# Altium schematic sheet FC_RGB.SchDoc
size A2; SheetNumber: 1; SheetTotal: 1
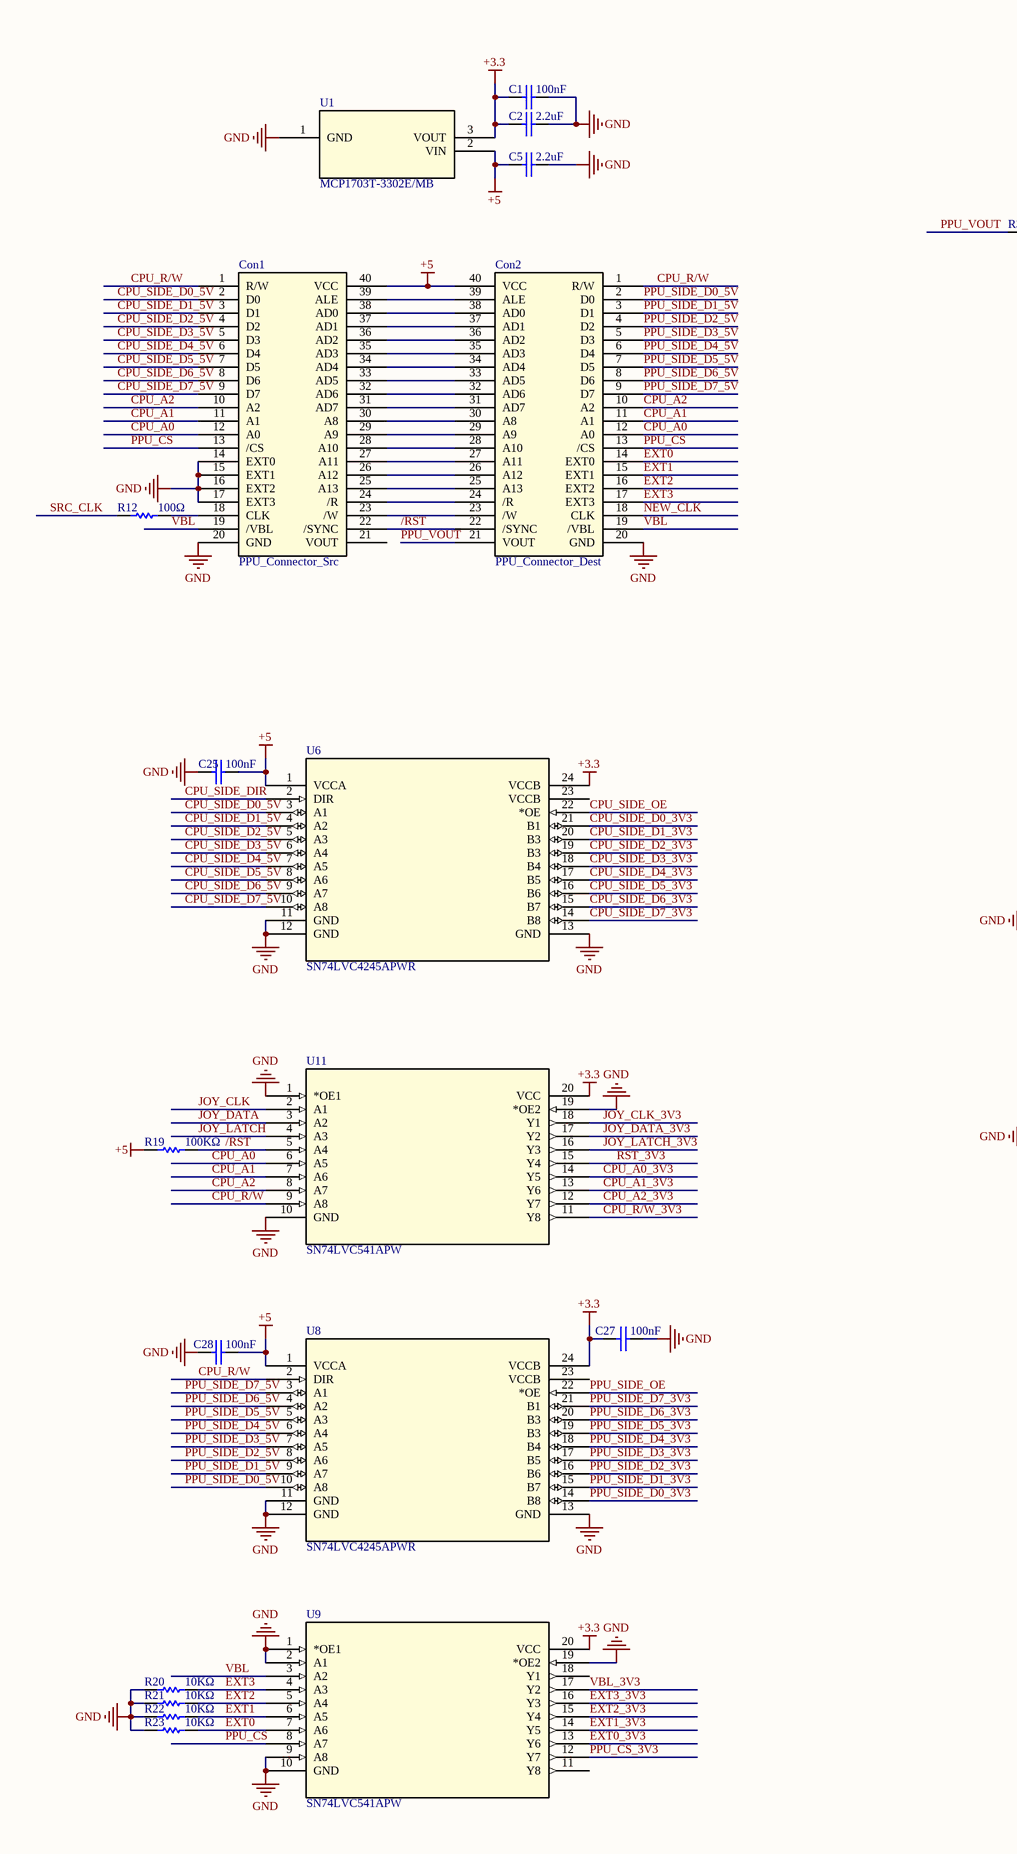
[diagram p0: FC_RGB.SchDoc, left]
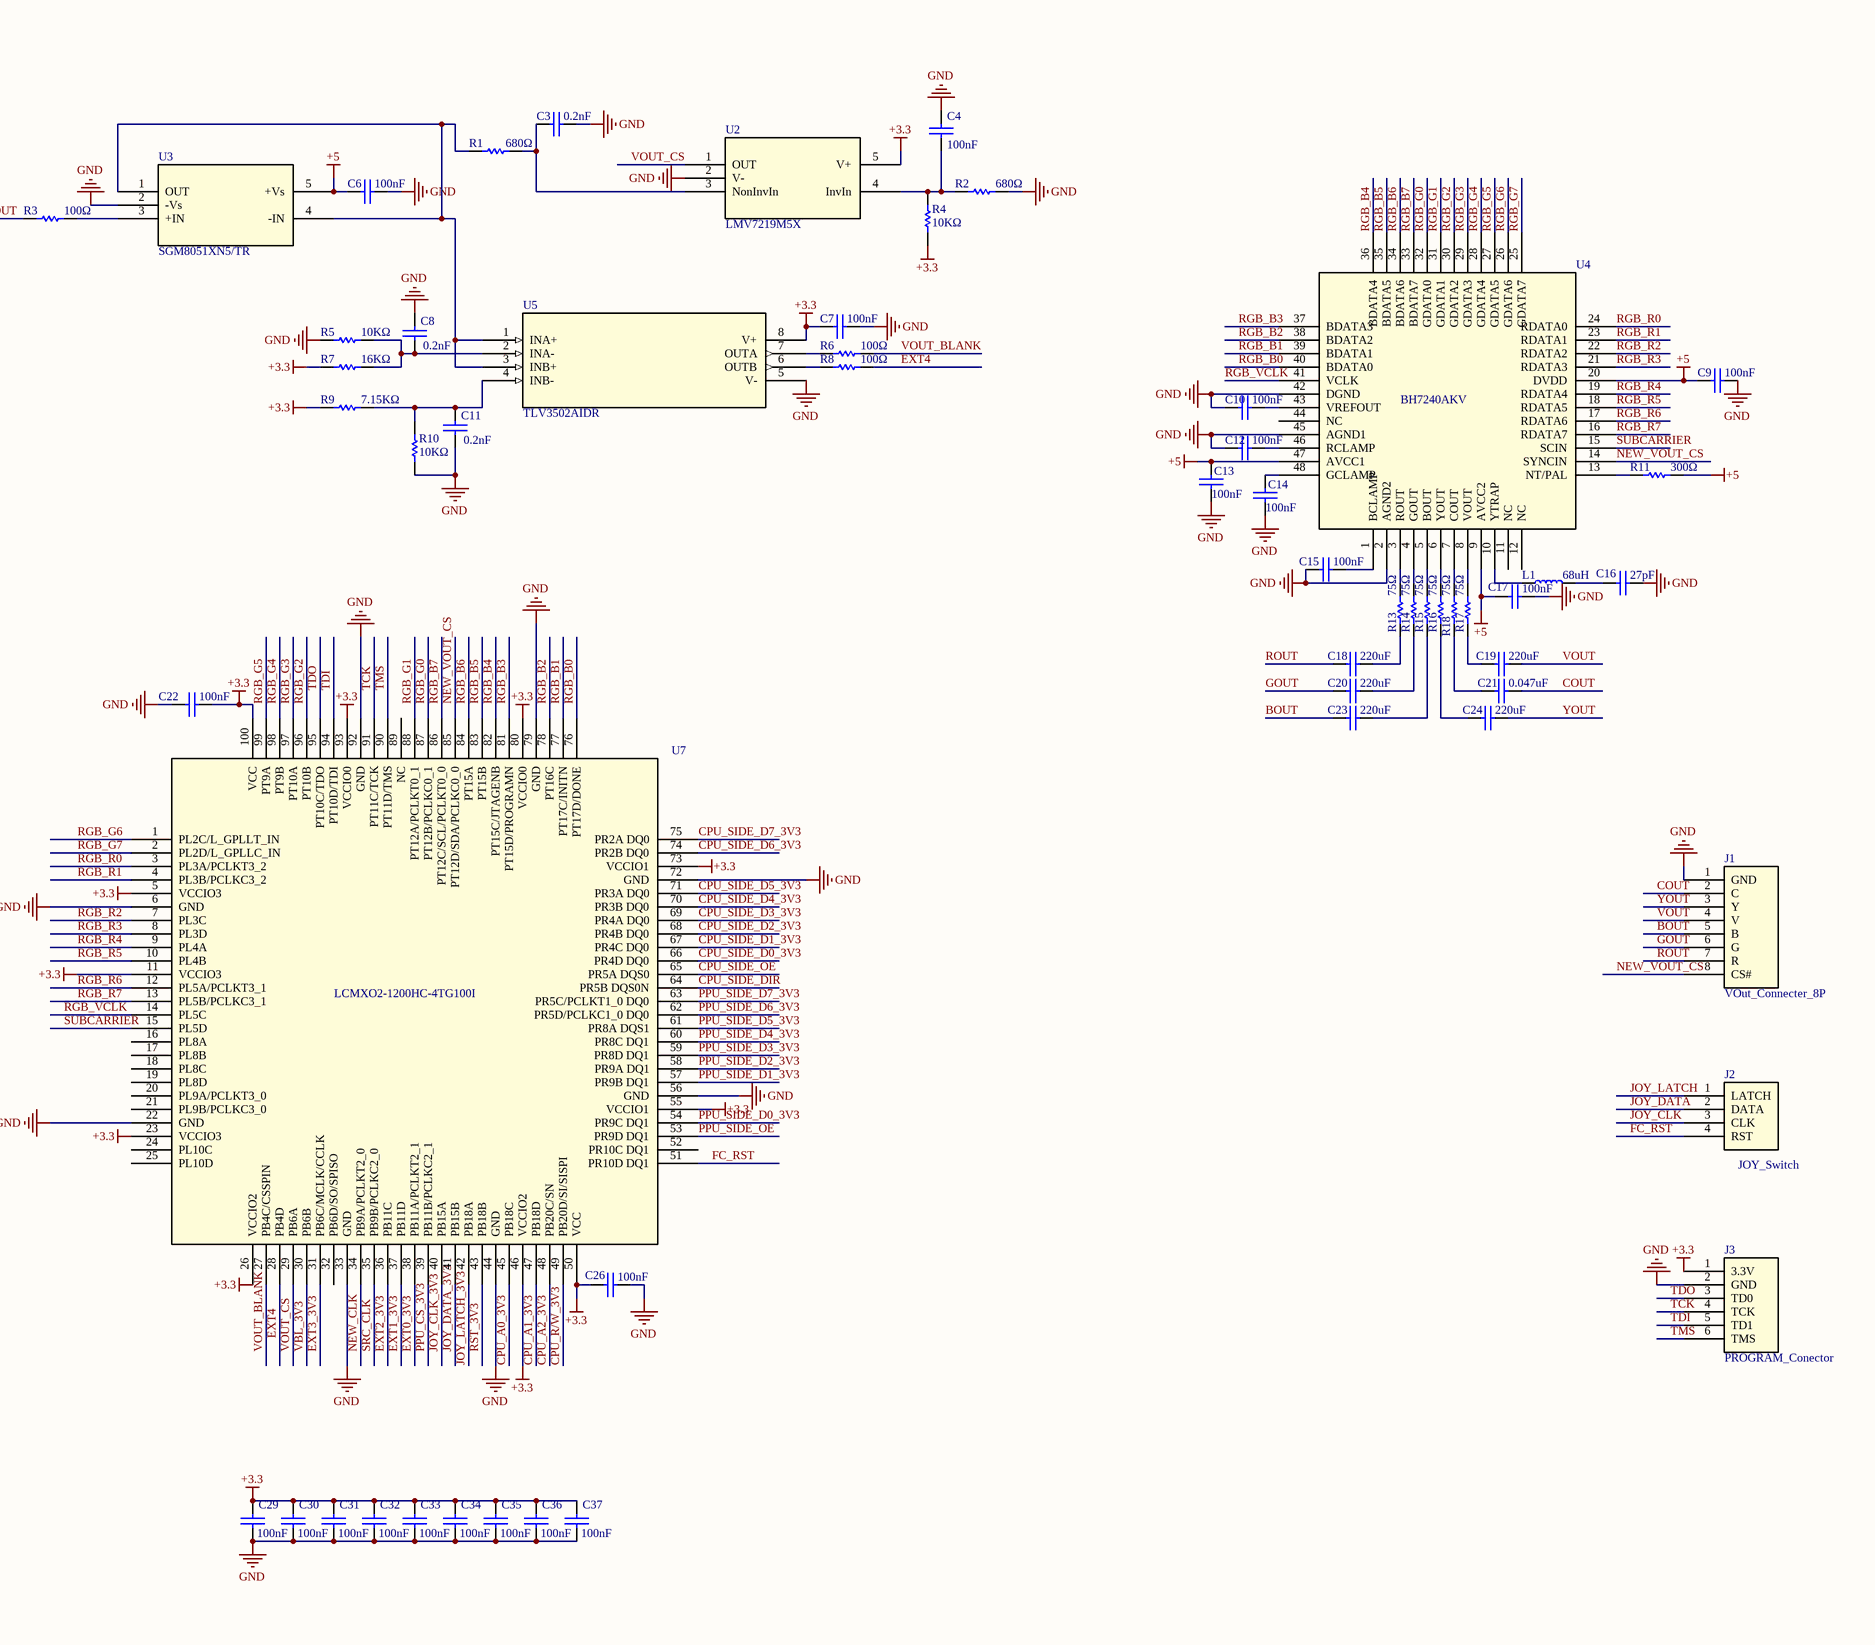
[diagram p1: FC_RGB.SchDoc, right]

## Parts
C1  100nF  [0603_C]
C2  2.2uF  [0805_C]
C3  0.2nF  [0603_C]
C4  100nF  [0603_C]
C5  2.2uF  [0805_C]
C6  100nF  [0603_C]
C7  100nF  [0603_C]
C8  0.2nF  [0603_C]
C9  100nF  [0603_C]
C10  100nF  [0603_C]
C11  0.2nF  [0603_C]
C12  100nF  [0603_C]
C13  100nF  [0603_C]
C14  100nF  [0603_C]
C15  100nF  [0603_C]
C16  27pF  [0603_C]
C17  100nF  [0603_C]
C18  220uF  [C 1206_L]
C19  220uF  [C 1206_L]
C20  220uF  [C 1206_L]
C21  0.047uF  [C 1206_L]
C22  100nF  [0603_C]
C23  220uF  [C 1206_L]
C24  220uF  [C 1206_L]
C25  100nF  [0603_C]
C26  100nF  [0603_C]
C27  100nF  [0603_C]
C28  100nF  [0603_C]
C29  100nF  [0603_C]
C30  100nF  [0603_C]
C31  100nF  [0603_C]
C32  100nF  [0603_C]
C33  100nF  [0603_C]
C34  100nF  [0603_C]
C35  100nF  [0603_C]
C36  100nF  [0603_C]
C37  100nF  [0603_C]
Con1  PPU_Connector_Src  [DIP40_SRC]
Con2  PPU_Connector_Dest  [DIP40_DEST]
J1  VOut_Connecter_8P  [CON_VIDEO_OUT_8P]
J2  JOY_Switch  [CON_JOY]
J3  PROGRAM_Conector  [CON_PROGRAM]
L1  68uH  [L 0805]
R1  680Ω  [0603_R]
R2  680Ω  [0603_R]
R3  100Ω  [0603_R]
R4  10KΩ  [0603_R]
R5  10KΩ  [0603_R]
R6  100Ω  [0603_R]
R7  16KΩ  [0603_R]
R8  100Ω  [0603_R]
R9  7.15KΩ  [0603_R]
R10  10KΩ  [0603_R]
R11  300Ω  [0603_R]
R12  100Ω  [0603_R]
R13  75Ω  [0603_R]
R14  75Ω  [0603_R]
R15  75Ω  [0603_R]
R16  75Ω  [0603_R]
R17  75Ω  [0603_R]
R18  75Ω  [0603_R]
R19  100KΩ  [0603_R]
R20  10KΩ  [0603_R]
R21  10KΩ  [0603_R]
R22  10KΩ  [0603_R]
R23  10KΩ  [0603_R]
U1  MCP1703T-3302E/MB  [SOT-89_3MC_MCH]
U2  LMV7219M5X  [MF05A]
U3  SGM8051XN5/TR  [MF05A]
U4  BH7240AKV  [LQFP48-7*7]
U5  TLV3502AIDR  [D8]
U6  SN74LVC4245APWR  [PW24]
U7  LCMXO2-1200HC-4TG100I  [TQFP100_LAT]
U8  SN74LVC4245APWR  [PW24]
U9  SN74LVC541APW  [PW20]
U11  SN74LVC541APW  [PW20]

## Nets
+3.3: C1.1 C2.1 C7.1 C22.2 C26.1 C27.1 C29.2 C30.2 C31.2 C32.2 C33.2 C34.2 C35.2 C36.2 C37.2 J3.1(3.3V) R4.1 R7.1 R9.1 U1.3(VOUT) U2.5(V+) U5.8(V+) U6.24(VCCB) U7.5(VCCIO3) U7.11(VCCIO3) U7.23(VCCIO3) U7.26(VCCIO2) U7.46(VCCIO2) U7.50(VCC) U7.55(VCCIO1) U7.73(VCCIO1) U7.80(VCCIO0) U7.93(VCCIO0) U7.100(VCC) U8.24(VCCB) U9.20(VCC) U11.20(VCC)
+5: C5.1 C6.1 C9.1 C13.2 C17.1 C25.2 C28.2 Con1.40(VCC) Con2.40(VCC) R11.2 R19.2 U1.2(VIN) U3.5(+Vs) U4.9(AVCC2) U4.20(DVDD) U4.47(AVCC1) U6.1(VCCA) U8.1(VCCA)
GND: C1.2 C2.2 C3.2 C4.2 C5.2 C6.2 C7.2 C8.2 C9.2 C10.1 C11.1 C12.1 C13.1 C14.1 C15.1 C16.2 C17.2 C22.1 C25.1 C26.2 C27.2 C28.1 C29.1 C30.1 C31.1 C32.1 C33.1 C34.1 C35.1 C36.1 C37.1 Con1.14(EXT0) Con1.15(EXT1) Con1.16(EXT2) Con1.17(EXT3) Con1.20(GND) Con2.20(GND) J1.1(GND) J3.2(GND) R2.2 R5.1 R10.1 R20.1 R21.1 R22.1 R23.1 U1.1(GND) U2.2(V-) U3.2(-Vs) U4.2(AGND2) U4.42(DGND) U4.45(AGND1) U5.5(V-) U6.11(GND) U6.12(GND) U6.13(GND) U7.6(GND) U7.22(GND) U7.33(GND) U7.44(GND) U7.56(GND) U7.72(GND) U7.79(GND) U7.92(GND) U8.11(GND) U8.12(GND) U8.13(GND) U9.1(*OE1) U9.2(A1) U9.9(A8) U9.10(GND) U9.19(*OE2) U11.1(*OE1) U11.10(GND) U11.19(*OE2)
/RST: Con1.22(/SYNC) Con2.22(/SYNC) R19.1 U11.5(A4)
BOUT: C23.2 J1.5(B)
COUT: C21.2 J1.2(C)
CPU_A0: Con1.12(A0) Con2.12(A0) U11.6(A5)
CPU_A0_3V3: U7.45(PB18C) U11.14(Y5)
CPU_A1: Con1.11(A1) Con2.11(A1) U11.7(A6)
CPU_A1_3V3: U7.47(PB18D) U11.13(Y6)
CPU_A2: Con1.10(A2) Con2.10(A2) U11.8(A7)
CPU_A2_3V3: U7.48(PB20C/SN) U11.12(Y7)
CPU_R/W: Con1.1(R/W) Con2.1(R/W) U8.2(DIR) U11.9(A8)
CPU_R/W_3V3: U7.49(PB20D/SI/SISPI) U11.11(Y8)
CPU_SIDE_D0_3V3: U6.21(B1) U7.66(PR4D_DQ0)
CPU_SIDE_D0_5V: Con1.2(D0) U6.3(A1)
CPU_SIDE_D1_3V3: U6.20(B3) U7.67(PR4C_DQ0)
CPU_SIDE_D1_5V: Con1.3(D1) U6.4(A2)
CPU_SIDE_D2_3V3: U6.19(B3) U7.68(PR4B_DQ0)
CPU_SIDE_D2_5V: Con1.4(D2) U6.5(A3)
CPU_SIDE_D3_3V3: U6.18(B4) U7.69(PR4A_DQ0)
CPU_SIDE_D3_5V: Con1.5(D3) U6.6(A4)
CPU_SIDE_D4_3V3: U6.17(B5) U7.70(PR3B_DQ0)
CPU_SIDE_D4_5V: Con1.6(D4) U6.7(A5)
CPU_SIDE_D5_3V3: U6.16(B6) U7.71(PR3A_DQ0)
CPU_SIDE_D5_5V: Con1.7(D5) U6.8(A6)
CPU_SIDE_D6_3V3: U6.15(B7) U7.74(PR2B_DQ0)
CPU_SIDE_D6_5V: Con1.8(D6) U6.9(A7)
CPU_SIDE_D7_3V3: U6.14(B8) U7.75(PR2A_DQ0)
CPU_SIDE_D7_5V: Con1.9(D7) U6.10(A8)
CPU_SIDE_DIR: U6.2(DIR) U7.64(PR5B_DQS0N)
CPU_SIDE_OE: U6.22(*OE) U7.65(PR5A_DQS0)
EXT0: Con2.14(EXT0) R23.2 U9.7(A6)
EXT0_3V3: U7.38(PB11A/PCLKT2_1) U9.13(Y6)
EXT1: Con2.15(EXT1) R22.2 U9.6(A5)
EXT1_3V3: U7.37(PB11D) U9.14(Y5)
EXT2: Con2.16(EXT2) R21.2 U9.5(A4)
EXT2_3V3: U7.36(PB11C) U9.15(Y4)
EXT3: Con2.17(EXT3) R20.2 U9.4(A3)
EXT3_3V3: U7.31(PB6C/MCLK/CCLK) U9.16(Y3)
EXT4: R8.2 U7.28(PB4D)
FC_RST: J2.4(RST) U7.51(PR10D_DQ1)
GOUT: C20.2 J1.6(G)
JOY_CLK: J2.3(CLK) U11.2(A1)
JOY_CLK_3V3: U7.40(PB15A) U11.18(Y1)
JOY_DATA: J2.2(DATA) U11.3(A2)
JOY_DATA_3V3: U7.41(PB15B) U11.17(Y2)
JOY_LATCH: J2.1(LATCH) U11.4(A3)
JOY_LATCH_3V3: U7.42(PB18A) U11.16(Y3)
NEW_CLK: Con2.18(CLK) U7.34(PB9A/PCLKT2_0)
NEW_VOUT_CS: J1.8(CS#) U4.14(SYNCIN) U7.85(PT12D/SDA/PCLKC0_0)
PPU_CS: Con1.13(/CS) Con2.13(/CS) U9.8(A7)
PPU_CS_3V3: U7.39(PB11B/PCLKC2_1) U9.12(Y7)
PPU_SIDE_D0_3V3: U7.54(PR9C_DQ1) U8.14(B8)
PPU_SIDE_D0_5V: Con2.2(D0) U8.10(A8)
PPU_SIDE_D1_3V3: U7.57(PR9B_DQ1) U8.15(B7)
PPU_SIDE_D1_5V: Con2.3(D1) U8.9(A7)
PPU_SIDE_D2_3V3: U7.58(PR9A_DQ1) U8.16(B6)
PPU_SIDE_D2_5V: Con2.4(D2) U8.8(A6)
PPU_SIDE_D3_3V3: U7.59(PR8D_DQ1) U8.17(B5)
PPU_SIDE_D3_5V: Con2.5(D3) U8.7(A5)
PPU_SIDE_D4_3V3: U7.60(PR8C_DQ1) U8.18(B4)
PPU_SIDE_D4_5V: Con2.6(D4) U8.6(A4)
PPU_SIDE_D5_3V3: U7.61(PR8A_DQS1) U8.19(B3)
PPU_SIDE_D5_5V: Con2.7(D5) U8.5(A3)
PPU_SIDE_D6_3V3: U7.62(PR5D/PCLKC1_0_DQ0) U8.20(B3)
PPU_SIDE_D6_5V: Con2.8(D6) U8.4(A2)
PPU_SIDE_D7_3V3: U7.63(PR5C/PCLKT1_0_DQ0) U8.21(B1)
PPU_SIDE_D7_5V: Con2.9(D7) U8.3(A1)
PPU_SIDE_OE: U7.53(PR9D_DQ1) U8.22(*OE)
PPU_VOUT: Con2.21(VOUT) R3.1
RGB_B0: U4.40(BDATA0) U7.76(PT17D/DONE)
RGB_B1: U4.39(BDATA1) U7.77(PT17C/INITN)
RGB_B2: U4.38(BDATA2) U7.78(PT16C)
RGB_B3: U4.37(BDATA3) U7.81(PT15D/PROGRAMN)
RGB_B4: U4.36(BDATA4) U7.82(PT15C/JTAGENB)
RGB_B5: U4.35(BDATA5) U7.83(PT15B)
RGB_B6: U4.34(BDATA6) U7.84(PT15A)
RGB_B7: U4.33(BDATA7) U7.86(PT12C/SCL/PCLKT0_0)
RGB_G0: U4.32(GDATA0) U7.87(PT12B/PCLKC0_1)
RGB_G1: U4.31(GDATA1) U7.88(PT12A/PCLKT0_1)
RGB_G2: U4.30(GDATA2) U7.96(PT10B)
RGB_G3: U4.29(GDATA3) U7.97(PT10A)
RGB_G4: U4.28(GDATA4) U7.98(PT9B)
RGB_G5: U4.27(GDATA5) U7.99(PT9A)
RGB_G6: U4.26(GDATA6) U7.1(PL2C/L_GPLLT_IN)
RGB_G7: U4.25(GDATA7) U7.2(PL2D/L_GPLLC_IN)
RGB_R0: U4.24(RDATA0) U7.3(PL3A/PCLKT3_2)
RGB_R1: U4.23(RDATA1) U7.4(PL3B/PCLKC3_2)
RGB_R2: U4.22(RDATA2) U7.7(PL3C)
RGB_R3: U4.21(RDATA3) U7.8(PL3D)
RGB_R4: U4.19(RDATA4) U7.9(PL4A)
RGB_R5: U4.18(RDATA5) U7.10(PL4B)
RGB_R6: U4.17(RDATA6) U7.12(PL5A/PCLKT3_1)
RGB_R7: U4.16(RDATA7) U7.13(PL5B/PCLKC3_1)
RGB_VCLK: U4.41(VCLK) U7.14(PL5C)
ROUT: C18.2 J1.7(R)
RST_3V3: U7.43(PB18B) U11.15(Y4)
SRC_CLK: R12.1 U7.35(PB9B/PCLKC2_0)
SUBCARRIER: U4.15(SCIN) U7.15(PL5D)
TCK: J3.4(TCK) U7.91(PT11C/TCK)
TDI: J3.5(TD1) U7.94(PT10D/TDI)
TDO: J3.3(TD0) U7.95(PT10C/TDO)
TMS: J3.6(TMS) U7.90(PT11D/TMS)
VBL: Con1.19(/VBL) Con2.19(/VBL) U9.3(A2)
VBL_3V3: U7.30(PB6B) U9.17(Y2)
VOUT: C19.1 J1.4(V)
VOUT_BLANK: R6.2 U7.27(PB4C/CSSPIN)
VOUT_CS: U2.1(OUT) U7.29(PB6A)
YOUT: C24.1 J1.3(Y)
NetC3_1: C3.1 R1.2 U2.3(NonInvIn)
NetC4_1: C4.1 R2.1 R4.2 U2.4(InvIn)
NetC8_1: C8.1 R5.2 R7.2 U5.2(INA-)
NetC10_2: C10.2 U4.43(VREFOUT)
NetC11_2: C11.2 R9.2 R10.2 U5.4(INB-)
NetC12_2: C12.2 U4.46(RCLAMP)
NetC14_2: C14.2 U4.48(GCLAMP)
NetC15_2: C15.2 U4.1(BCLAMP)
NetC16_1: C16.1 L1.2
NetC18_1: C18.1 R13.1
NetC19_2: C19.2 R17.1
NetC20_1: C20.1 R14.1
NetC21_1: C21.1 R18.1
NetC23_1: C23.1 R15.1
NetC24_2: C24.2 R16.1
NetCon1_18: Con1.18(CLK) R12.2
NetCon1_23: Con1.23(/W) Con2.23(/W)
NetCon1_24: Con1.24(/R) Con2.24(/R)
NetCon1_25: Con1.25(A13) Con2.25(A13)
NetCon1_26: Con1.26(A12) Con2.26(A12)
NetCon1_27: Con1.27(A11) Con2.27(A11)
NetCon1_28: Con1.28(A10) Con2.28(A10)
NetCon1_29: Con1.29(A9) Con2.29(A9)
NetCon1_30: Con1.30(A8) Con2.30(A8)
NetCon1_31: Con1.31(AD7) Con2.31(AD7)
NetCon1_32: Con1.32(AD6) Con2.32(AD6)
NetCon1_33: Con1.33(AD5) Con2.33(AD5)
NetCon1_34: Con1.34(AD4) Con2.34(AD4)
NetCon1_35: Con1.35(AD3) Con2.35(AD3)
NetCon1_36: Con1.36(AD2) Con2.36(AD2)
NetCon1_37: Con1.37(AD1) Con2.37(AD1)
NetCon1_38: Con1.38(AD0) Con2.38(AD0)
NetCon1_39: Con1.39(ALE) Con2.39(ALE)
NetL1_1: L1.1 U4.10(YTRAP)
NetR1_1: R1.1 U3.1(OUT) U3.4(-IN) U5.1(INA+) U5.3(INB+)
NetR3_2: R3.2 U3.3(+IN)
NetR6_1: R6.1 U5.7(OUTA)
NetR8_1: R8.1 U5.6(OUTB)
NetR11_1: R11.1 U4.13(NT/PAL)
NetR13_2: R13.2 U4.3(ROUT)
NetR14_2: R14.2 U4.4(GOUT)
NetR15_2: R15.2 U4.5(BOUT)
NetR16_2: R16.2 U4.6(YOUT)
NetR17_2: R17.2 U4.8(VOUT)
NetR18_2: R18.2 U4.7(COUT)

Not connected (* = marked no-connect by the designer): Con1 21(VOUT); U4 11(NC) 12(NC) 44(NC); U6 23(VCCB); U7 16(PL8A) 17(PL8B) 18(PL8C) 19(PL8D) 20(PL9A/PCLKT3_0) 21(PL9B/PCLKC3_0) 24(PL10C) 25(PL10D) 32(PB6D/SO/SPISO) 52(PR10C_DQ1) 89(NC); U8 23(VCCB); U9 11(Y8) 18(Y1)

## Library data of the parts
C1 C3 C4 C6-C17 C22 C25-C37 = C0603: No Description Available; Mfr_Name: Kemet; Manufacturer_Part_Number: C0603X394K4RACAUTO; Type: DEV; Copyright: Copyright (C) 2022 Ultra Librarian. All rights reserved.; RefDes: RefDes
C2 C5 = C0805: No Description Available; Mfr_Name: Kemet; Manufacturer_Part_Number: C0603X394K4RACAUTO; Type: DEV; Copyright: Copyright (C) 2022 Ultra Librarian. All rights reserved.; RefDes: RefDes
C18-C21 C23 C24 = C1206: No Description Available; Mfr_Name: Kemet; Manufacturer_Part_Number: C0603X394K4RACAUTO; Type: DEV; Copyright: Copyright (C) 2022 Ultra Librarian. All rights reserved.; RefDes: RefDes
L1 = L0805
R1-R23 = R0603: No Description Available; Mfr_Name: Yageo; Manufacturer_Part_Number: RC0603FR-07200RL; Copyright: Copyright (C) 2022 Ultra Librarian. All rights reserved.; RefDes: RefDes; Type: DEV
U1 = MCP1703T-3302E/MB: No Description Available; Mfr_Name: Microchip; Copyright: Copyright (C) 2022 Ultra Librarian. All rights reserved.; Manufacturer_Part_Number: MCP1703T-3302E/MB; RefDes: RefDes; Type: DEV
U2 = LMV7219M5X: C14A; Mfr_Name: Microchip; Manufacturer_Part_Number: MCP1703T-3302E/MB; Copyright: Copyright (C) 2022 Ultra Librarian. All rights reserved.; RefDes: RefDes; Type: DEV
U3 = SGM808051XN5/TR: 8051; Mfr_Name: Microchip; Manufacturer_Part_Number: MCP1703T-3302E/MB; Copyright: Copyright (C) 2022 Ultra Librarian. All rights reserved.; RefDes: RefDes; Type: DEV
U4 = BH7240AKV: No Description Available; Mfr_Name: Analog Devices Inc; Manufacturer_Part_Number: ADV7123JSTZ330; Copyright: Copyright (C) 2022 Ultra Librarian. All rights reserved.; RefDes: RefDes; Type: DEV
U5 = TLV3502AIDCNR: NXC; Mfr_Name: Texas Instruments; Copyright: Copyright (C) 2022 Ultra Librarian. All rights reserved.; Manufacturer_Part_Number: TLV3502AIDCNR; RefDes: RefDes; Type: DEV
U6 U8 = SN74LVC4245APWR: LJ245A; Mfr_Name: Texas Instruments; Copyright: Copyright (C) 2022 Ultra Librarian. All rights reserved.; Manufacturer_Part_Number: SN74LVC4245APWR; RefDes: RefDes; Type: DEV
U7 = LCMXO2-1200HC: No Description Available; Mfr_Name: Lattice; Copyright: Copyright (C) 2023 Ultra Librarian. All rights reserved.; Manufacturer_Part_Number: LCMXO2-1200HC-4TG100I; RefDes: RefDes; Type: DEV
U9 U11 = SN74LVC541APW: LC541A; Mfr_Name: Texas Instruments; Copyright: Copyright (C) 2022 Ultra Librarian. All rights reserved.; Manufacturer_Part_Number: SN74LVC541APW; RefDes: RefDes; Type: DEV